# Altium schematic sheet 04_MCU.SchDoc
size A3; SheetNumber: 4; SheetTotal: 6
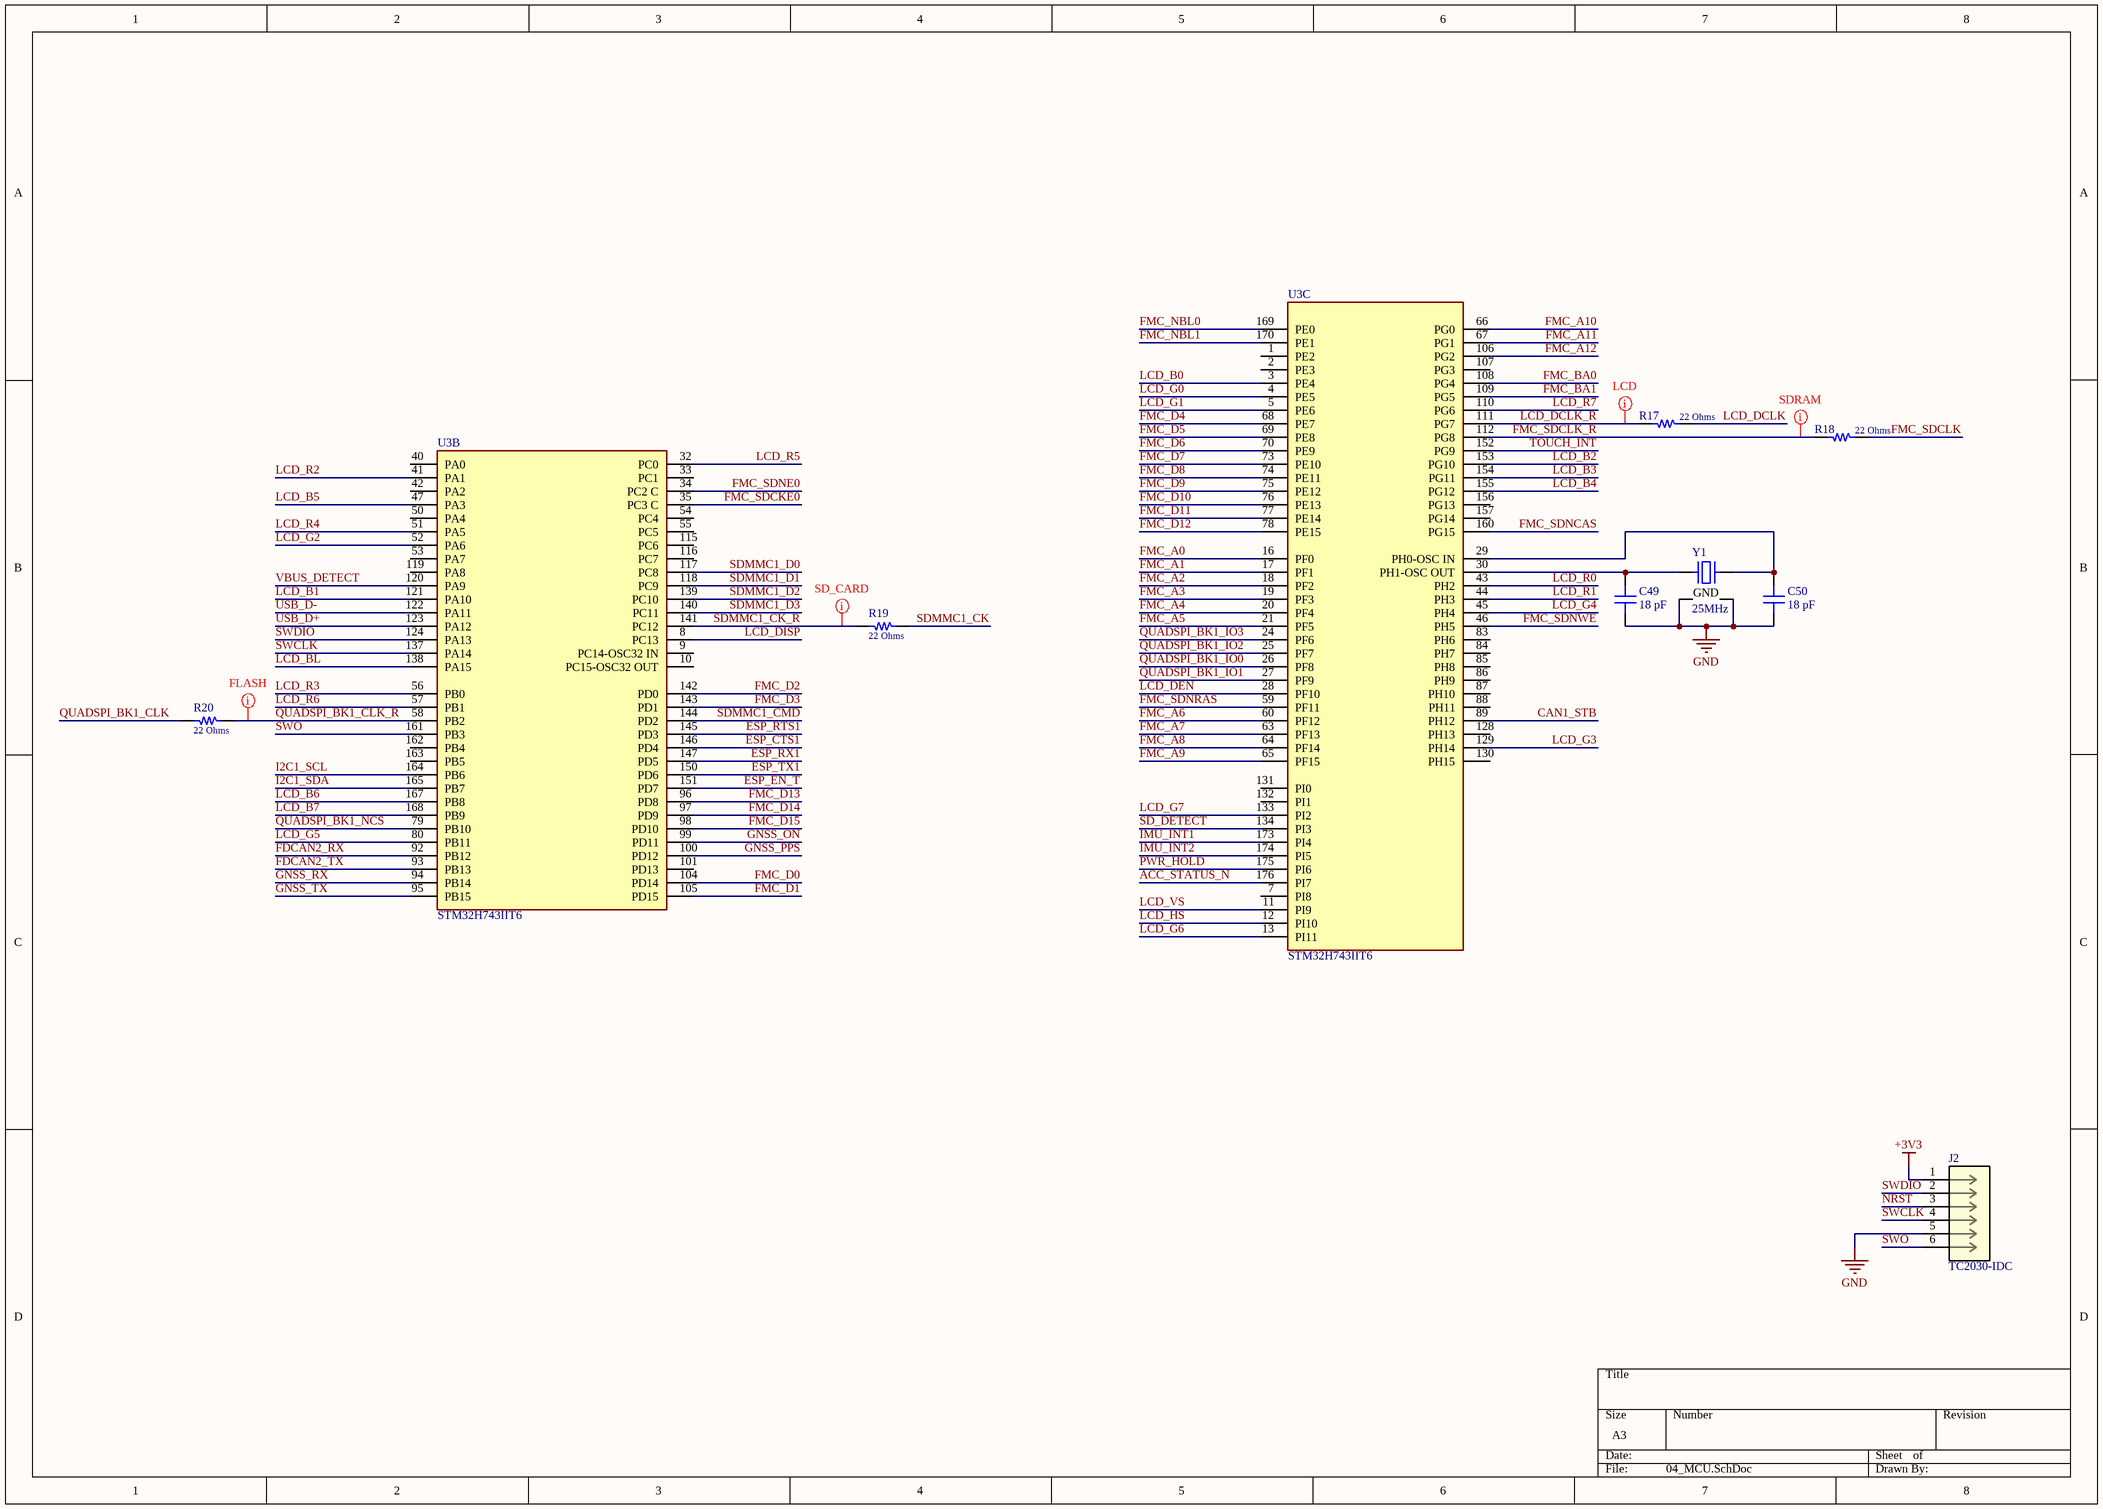
[diagram p0: 04_MCU.SchDoc]

## Parts
C49  18 pF  [CAP 0402_1005]
C50  18 pF  [CAP 0402_1005]
J2  TC2030-IDC  [CONN_TC2030-IDC_TGC]
R17  22 Ohms  [RES 0402_1005]
R18  22 Ohms  [RES 0402_1005]
R19  22 Ohms  [RES 0402_1005]
R20  22 Ohms  [RES 0402_1005]
U3  STM32H743IIT6  [FP-LQFP176-1T-MFG]  (parts B,C of 3)
Y1  25MHz  [NDK NX3225SA]

## Nets
+3V3: J2.1
GND: C49.1 C50.1 J2.5 Y1.2(GND) Y1.4(GND)
ACC_STATUS_N: U3.176(PI7)
CAN1_STB: U3.89(PH12)
ESP_CTS1: U3.146(PD4)
ESP_EN_T: U3.151(PD7)
ESP_RTS1: U3.145(PD3)
ESP_RX1: U3.147(PD5)
ESP_TX1: U3.150(PD6)
FDCAN2_RX: U3.92(PB12)
FDCAN2_TX: U3.93(PB13)
FMC_A0: U3.16(PF0)
FMC_A1: U3.17(PF1)
FMC_A2: U3.18(PF2)
FMC_A3: U3.19(PF3)
FMC_A4: U3.20(PF4)
FMC_A5: U3.21(PF5)
FMC_A6: U3.60(PF12)
FMC_A7: U3.63(PF13)
FMC_A8: U3.64(PF14)
FMC_A9: U3.65(PF15)
FMC_A10: U3.66(PG0)
FMC_A11: U3.67(PG1)
FMC_A12: U3.106(PG2)
FMC_BA0: U3.108(PG4)
FMC_BA1: U3.109(PG5)
FMC_D0: U3.104(PD14)
FMC_D1: U3.105(PD15)
FMC_D2: U3.142(PD0)
FMC_D3: U3.143(PD1)
FMC_D4: U3.68(PE7)
FMC_D5: U3.69(PE8)
FMC_D6: U3.70(PE9)
FMC_D7: U3.73(PE10)
FMC_D8: U3.74(PE11)
FMC_D9: U3.75(PE12)
FMC_D10: U3.76(PE13)
FMC_D11: U3.77(PE14)
FMC_D12: U3.78(PE15)
FMC_D13: U3.96(PD8)
FMC_D14: U3.97(PD9)
FMC_D15: U3.98(PD10)
FMC_NBL0: U3.169(PE0)
FMC_NBL1: U3.170(PE1)
FMC_SDCKE0: U3.35(PC3_C)
FMC_SDCLK: R18.1
FMC_SDCLK_R: R18.2 U3.112(PG8)
FMC_SDNCAS: U3.160(PG15)
FMC_SDNE0: U3.34(PC2_C)
FMC_SDNRAS: U3.59(PF11)
FMC_SDNWE: U3.46(PH5)
GNSS_ON: U3.99(PD11)
GNSS_PPS: U3.100(PD12)
GNSS_RX: U3.94(PB14)
GNSS_TX: U3.95(PB15)
I2C1_SCL: U3.164(PB6)
I2C1_SDA: U3.165(PB7)
IMU_INT1: U3.173(PI4)
IMU_INT2: U3.174(PI5)
LCD_B0: U3.3(PE4)
LCD_B1: U3.121(PA10)
LCD_B2: U3.153(PG10)
LCD_B3: U3.154(PG11)
LCD_B4: U3.155(PG12)
LCD_B5: U3.47(PA3)
LCD_B6: U3.167(PB8)
LCD_B7: U3.168(PB9)
LCD_BL: U3.138(PA15)
LCD_DCLK: R17.1
LCD_DCLK_R: R17.2 U3.111(PG7)
LCD_DEN: U3.28(PF10)
LCD_DISP: U3.8(PC13)
LCD_G0: U3.4(PE5)
LCD_G1: U3.5(PE6)
LCD_G2: U3.52(PA6)
LCD_G3: U3.129(PH14)
LCD_G4: U3.45(PH4)
LCD_G5: U3.80(PB11)
LCD_G6: U3.13(PI11)
LCD_G7: U3.133(PI2)
LCD_HS: U3.12(PI10)
LCD_R0: U3.43(PH2)
LCD_R1: U3.44(PH3)
LCD_R2: U3.41(PA1)
LCD_R3: U3.56(PB0)
LCD_R4: U3.51(PA5)
LCD_R5: U3.32(PC0)
LCD_R6: U3.57(PB1)
LCD_R7: U3.110(PG6)
LCD_VS: U3.11(PI9)
NRST: J2.3
PWR_HOLD: U3.175(PI6)
QUADSPI_BK1_CLK: R20.2
QUADSPI_BK1_CLK_R: R20.1 U3.58(PB2)
QUADSPI_BK1_IO0: U3.26(PF8)
QUADSPI_BK1_IO1: U3.27(PF9)
QUADSPI_BK1_IO2: U3.25(PF7)
QUADSPI_BK1_IO3: U3.24(PF6)
QUADSPI_BK1_NCS: U3.79(PB10)
SD_DETECT: U3.134(PI3)
SDMMC1_CK: R19.1
SDMMC1_CK_R: R19.2 U3.141(PC12)
SDMMC1_CMD: U3.144(PD2)
SDMMC1_D0: U3.117(PC8)
SDMMC1_D1: U3.118(PC9)
SDMMC1_D2: U3.139(PC10)
SDMMC1_D3: U3.140(PC11)
SWCLK: J2.4 U3.137(PA14)
SWDIO: J2.2 U3.124(PA13)
SWO: J2.6 U3.161(PB3)
TOUCH_INT: U3.152(PG9)
USB_D+: U3.123(PA12)
USB_D-: U3.122(PA11)
VBUS_DETECT: U3.120(PA9)
NetC49_2: C49.2 U3.30(PH1-OSC_OUT) Y1.1
NetC50_2: C50.2 U3.29(PH0-OSC_IN) Y1.3

Not connected (* = marked no-connect by the designer): U3 1(PE2) 2(PE3) 7(PI8) 9(PC14-OSC32_IN) 10(PC15-OSC32_OUT) 33(PC1) 40(PA0) 42(PA2) 50(PA4) 53(PA7) 54(PC4) 55(PC5) 83(PH6) 84(PH7) 85(PH8) 86(PH9) 87(PH10) 88(PH11) 101(PD13) 107(PG3) 115(PC6) 116(PC7) 119(PA8) 128(PH13) 130(PH15) 131(PI0) 132(PI1) 156(PG13) 157(PG14) 162(PB4) 163(PB5)

## Layout directives
mark named SD_CARD: SDMMC1_CK_R
mark named FLASH: QUADSPI_BK1_CLK_R
mark named SDRAM: FMC_SDCLK_R
mark named LCD: LCD_DCLK_R

## Library data of the parts
C49 C50 = CC0402JRNPO9BN180: CAP CER 18PF 50V C0G/NPO 0402; Manufacturer: Yageo; id: 1151; Temperature Coefficient: C0G, NP0; Tolerance: ±5%; Part Number: CC0402JRNPO9BN180; Value: 18 pF; Supplier Part Number 1: 311-1415-1-ND; ComponentLink2Description: DigiKey Link; ComponentLink1URL: https://www.yageo.com/upload/media/product/productsearch/datasheet/mlcc/UPY-GP_NP0_16V-to-50V_17.pdf; PartId: 4846; Supplier 1: DigiKey; Series: CC; LastUpdated: 2023-01-03T20:04:10.103; Part Status: Active; Capacitance: 18 pF; Device Package: 0402 (1005 Metric); Thickness (Max): 0.022" (0.55mm); Voltage - Rated: 50V; Minimum Order: 1; Packaging: CutTape; Applications: General Purpose; Package / Case: 0402 (1005 Metric); ComponentLink1Description: Datasheet; Price: 0.01; ComponentLink2URL: https://www.digikey.com/en/products/detail/yageo/CC0402JRNPO9BN180/2833580; Lifecycle Status: Active; Operating Temperature: -55°C ~ 125°C; Size / Dimension: 0.039" L x 0.020" W (1.00mm x 0.50mm); Mounting Type: Surface Mount, MLCC
J2 = TC2030-IDC: Description; Manufacturer_Name: Tag-Connect; Copyright: Copyright (C) 2025 Ultra Librarian. All rights reserved.; Manufacturer_Part_Number: TC2030-IDC; RefDes: RefDes; Type: Type
R17-R20 = RC0402FR-0722RL: RES 22 OHM 1% 1/16W 0402; Manufacturer: Yageo; id: 7818; Temperature Coefficient: ±100ppm/°C; Power (Watts): 0.063W, 1/16W; Part Number: RC0402FR-0722RL; Height - Seated (Max): 0.016" (0.40mm); Supplier Part Number 1: 311-22.0LRCT-ND; Supplier Device Package: 0402; ComponentLink1Description: Datasheet; ComponentLink2URL: https://www.digikey.com/en/products/detail/yageo/RC0402FR-0722RL/726562; Features: Moisture Resistant; ComponentLink1URL: https://www.yageo.com/upload/media/product/productsearch/datasheet/rchip/PYu-RC_Group_51_RoHS_L_10.pdf; Composition: Thick Film; Tolerance: ±1%; Supplier 1: DigiKey; Series: RC_L; Part Status: Active; ComponentLink2Description: DigiKey Link; Device Package: 0402 (1005 Metric); Packaging: CutTape; Minimum Order: 1; Package / Case: 0402 (1005 Metric); PartId: 17600; Lifecycle Status: Active; LastUpdated: 2023-01-02T20:20:45.730; Operating Temperature: -55°C ~ 155°C; Number Of Terminations: 2; Value: 22 Ohms; Size / Dimension: 0.039" L x 0.020" W (1.00mm x 0.50mm); Price: 0.01; Resistance: 22 Ohms
U3 = CMP-12105-000078-1: IC MCU 32BIT 2MB FLASH 176LQFP; Manufacturer: STMicroelectronics; Number Of I/Os: 140; Number Of Pwm Channels: 2; Standoff Height: 0.05mm; Number Of Uart Channels: 9; Frequency: 400MHz; Core Architecture: ARM Cortex-M7; Ram Size: 1MBytes; Max Supply Voltage: 3.6V; Number Of Timers/Counters: 20; Min Supply Voltage: 1.62V; Number Of I2C Channels: 4; Number Of Cores: 1; Max Junction Temp: +125°C; Data Bus Width: 32bits; Memory Size: 2MBytes; Number Of Adc Channels: 36; Number Of Spi Channels: 6; Interface: I2C,SPI,UART,USART,CAN,USB,LIN,IrDA,Ethernet,SMBus,Other; Number Of A/D Converters: 3; Digikey Description: IC MCU 32BIT 2MB FLASH 176LQFP; Temperature: -40°C to +125°C; Package: LQFP176-1T; RoHS: TRUE; Memory Type: FLASH; Device Class L3: Microcontrollers; Manufacturer Part Number: STM32H743IIT6; Mouser Description: MCU 32-Bit STM32 ARM Cortex M7 RISC 2MB Flash 1.8V/2.5V/3.3V 176-Pin LQFP Tray; Category: IC; Automotive: No; Ambient Temperature Range High: +85°C; Number Of Usb Channels: 2; ComponentLink2URL: https://www.st.com/resource/en/datasheet/stm32h743ii.pdf; Lead Free: Yes; Ambient Temperature Range Low: -40°C; ComponentLink2Description: Datasheet; Device Class L2: Embedded Processors and Controllers; Octopart: https://octopart.com/stm32h743iit6-stmicroelectronics-76372526; Device Class L1: Integrated Circuits (ICs); Height: 1.6mm; Temperature Range Low: -40°C; Temperature Range High: +125°C; Number Of Ethernet Channels: 1; Ipc Land Pattern Name: QFP50P2600X2600X160-176
Y1 = YXC X322525MOB4SI: CRYSTAL 25MHz 12pF SMD; Value: 25MHz